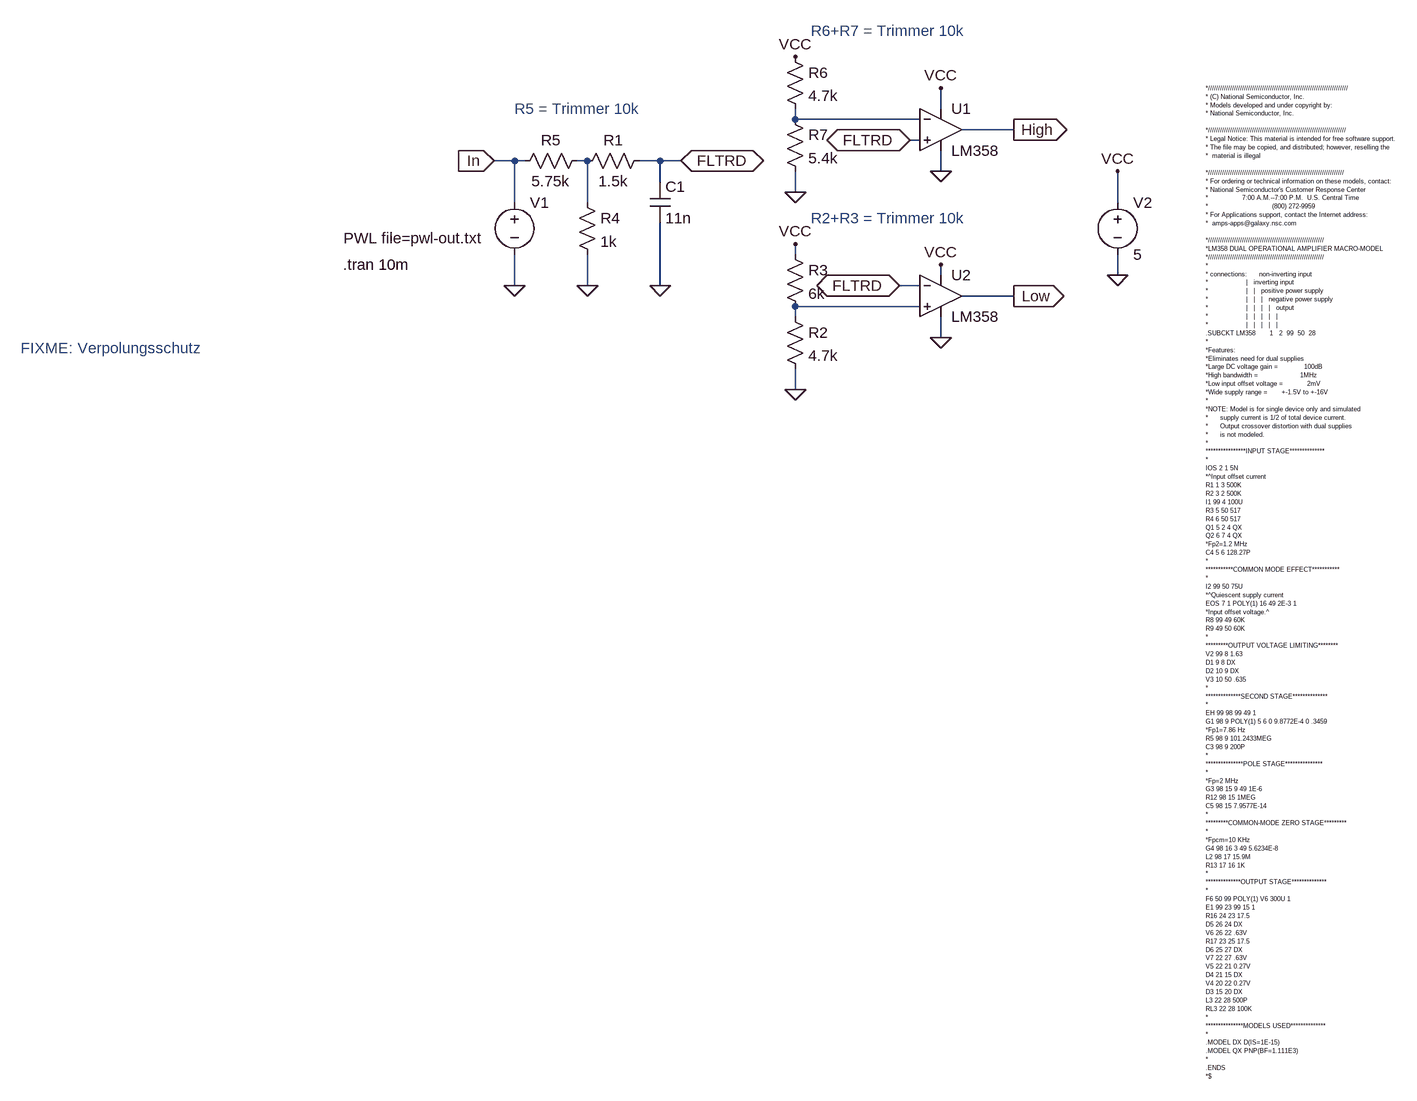
[diagram p0: schematic Konverter_ganzneu2.asc]
Konverter_ganzneu2.asc, the LTspice schematic file:
Version 4
SHEET 1 1720 724
WIRE 720 -656 720 -688
WIRE 496 -640 496 -656
WIRE 688 -640 496 -640
WIRE 832 -624 752 -624
WIRE 688 -608 672 -608
WIRE 64 -576 32 -576
WIRE 80 -576 64 -576
WIRE 176 -576 160 -576
WIRE 288 -576 256 -576
WIRE 320 -576 288 -576
WIRE 720 -560 720 -592
WIRE 288 -544 288 -576
WIRE 496 -528 496 -560
WIRE 64 -512 64 -576
WIRE 176 -512 176 -576
WIRE 992 -512 992 -560
WIRE 496 -432 496 -448
WIRE 720 -400 720 -416
WIRE 992 -400 992 -432
WIRE 64 -384 64 -432
WIRE 176 -384 176 -432
WIRE 288 -384 288 -480
WIRE 688 -384 656 -384
WIRE 832 -368 752 -368
WIRE 688 -352 496 -352
WIRE 496 -336 496 -352
WIRE 720 -304 720 -336
WIRE 496 -224 496 -256
FLAG 64 -384 0
FLAG 32 -576 In
IOPIN 32 -576 In
FLAG 832 -368 Low
IOPIN 832 -368 Out
FLAG 832 -624 High
IOPIN 832 -624 Out
FLAG 176 -384 0
FLAG 288 -384 0
FLAG 720 -560 0
FLAG 720 -304 0
FLAG 496 -528 0
FLAG 496 -224 0
FLAG 992 -400 0
FLAG 992 -560 VCC
FLAG 720 -688 VCC
FLAG 720 -416 VCC
FLAG 496 -736 VCC
FLAG 320 -576 FLTRD
IOPIN 320 -576 BiDir
FLAG 672 -608 FLTRD
IOPIN 672 -608 BiDir
FLAG 496 -448 VCC
FLAG 656 -384 FLTRD
IOPIN 656 -384 BiDir
SYMBOL voltage 64 -528 R0
WINDOW 3 -263 71 Left 2
WINDOW 123 24 44 Left 2
WINDOW 39 24 44 Left 2
SYMATTR Value PWL file=pwl-out.txt
SYMATTR InstName V1
SYMBOL res 272 -592 R90
WINDOW 0 0 56 VBottom 2
WINDOW 3 32 56 VTop 2
SYMATTR InstName R1
SYMATTR Value 1.5k
SYMATTR SpiceLine tol=5
SYMBOL cap 272 -544 R0
SYMATTR InstName C1
SYMATTR Value 11n
SYMATTR SpiceLine V=25 Irms=728m Rser=0.14361 Lser=0
SYMBOL res 160 -528 R0
SYMATTR InstName R4
SYMATTR Value 1k
SYMBOL res 176 -592 R90
WINDOW 0 0 56 VBottom 2
WINDOW 3 32 56 VTop 2
SYMATTR InstName R5
SYMATTR Value 5.75k
SYMBOL voltage 992 -528 R0
WINDOW 123 0 0 Left 0
WINDOW 39 0 0 Left 0
SYMATTR InstName V2
SYMATTR Value 5
SYMBOL res 480 -352 R0
SYMATTR InstName R2
SYMATTR Value 4.7k
SYMBOL res 480 -448 R0
SYMATTR InstName R3
SYMATTR Value 6k
SYMBOL res 480 -752 R0
SYMATTR InstName R6
SYMATTR Value 4.7k
SYMBOL res 480 -656 R0
SYMATTR InstName R7
SYMATTR Value 5.4k
SYMBOL Opamps\\opamp2 720 -688 R0
SYMATTR InstName U1
SYMATTR Value LM358
SYMBOL Opamps\\opamp2 720 -432 R0
SYMATTR InstName U2
SYMATTR Value LM358
TEXT -200 -416 Left 2 !.tran 10m
TEXT 64 -656 Left 2 ;R5 = Trimmer 10k
TEXT 520 -776 Left 2 ;R6+R7 = Trimmer 10k
TEXT 520 -488 Left 2 ;R2+R3 = Trimmer 10k
TEXT -696 -288 Left 2 ;FIXME: Verpolungsschutz
TEXT 1128 -688 Left 0 !*//////////////////////////////////////////////////////////////////////\n* (C) National Semiconductor, Inc.\n* Models developed and under copyright by:\n* National Semiconductor, Inc.  \n \n*/////////////////////////////////////////////////////////////////////\n* Legal Notice: This material is intended for free software support.\n* The file may be copied, and distributed; however, reselling the \n*  material is illegal\n \n*////////////////////////////////////////////////////////////////////\n* For ordering or technical information on these models, contact:\n* National Semiconductor's Customer Response Center\n*                 7:00 A.M.--7:00 P.M.  U.S. Central Time\n*                                (800) 272-9959\n* For Applications support, contact the Internet address:\n*  amps-apps@galaxy.nsc.com\n \n*//////////////////////////////////////////////////////////\n*LM358 DUAL OPERATIONAL AMPLIFIER MACRO-MODEL\n*//////////////////////////////////////////////////////////\n*\n* connections:      non-inverting input\n*                   |   inverting input\n*                   |   |   positive power supply\n*                   |   |   |   negative power supply\n*                   |   |   |   |   output\n*                   |   |   |   |   |\n*                   |   |   |   |   |\n.SUBCKT LM358       1   2  99  50  28\n*\n*Features:\n*Eliminates need for dual supplies\n*Large DC voltage gain =             100dB\n*High bandwidth =                     1MHz\n*Low input offset voltage =            2mV\n*Wide supply range =       +-1.5V to +-16V\n*\n*NOTE: Model is for single device only and simulated\n*      supply current is 1/2 of total device current.\n*      Output crossover distortion with dual supplies\n*      is not modeled.\n*\n****************INPUT STAGE**************\n*\nIOS 2 1 5N\n*^Input offset current\nR1 1 3 500K\nR2 3 2 500K\nI1 99 4 100U\nR3 5 50 517\nR4 6 50 517\nQ1 5 2 4 QX\nQ2 6 7 4 QX\n*Fp2=1.2 MHz\nC4 5 6 128.27P\n*\n***********COMMON MODE EFFECT***********\n*\nI2 99 50 75U\n*^Quiescent supply current\nEOS 7 1 POLY(1) 16 49 2E-3 1\n*Input offset voltage.^\nR8 99 49 60K\nR9 49 50 60K\n*\n*********OUTPUT VOLTAGE LIMITING********\nV2 99 8 1.63\nD1 9 8 DX\nD2 10 9 DX\nV3 10 50 .635\n*\n**************SECOND STAGE**************\n*\nEH 99 98 99 49 1\nG1 98 9 POLY(1) 5 6 0 9.8772E-4 0 .3459\n*Fp1=7.86 Hz\nR5 98 9 101.2433MEG\nC3 98 9 200P\n*\n***************POLE STAGE***************\n*\n*Fp=2 MHz\nG3 98 15 9 49 1E-6\nR12 98 15 1MEG\nC5 98 15 7.9577E-14\n*\n*********COMMON-MODE ZERO STAGE*********\n*\n*Fpcm=10 KHz\nG4 98 16 3 49 5.6234E-8               \nL2 98 17 15.9M\nR13 17 16 1K\n*\n**************OUTPUT STAGE**************\n*\nF6 50 99 POLY(1) V6 300U 1\nE1 99 23 99 15 1\nR16 24 23 17.5\nD5 26 24 DX\nV6 26 22 .63V\nR17 23 25 17.5\nD6 25 27 DX\nV7 22 27 .63V\nV5 22 21 0.27V\nD4 21 15 DX\nV4 20 22 0.27V\nD3 15 20 DX\nL3 22 28 500P\nRL3 22 28 100K\n*\n***************MODELS USED**************\n*\n.MODEL DX D(IS=1E-15)\n.MODEL QX PNP(BF=1.111E3)\n*\n.ENDS\n*$

The netlist it stands for:
* Konverter_ganzneu2.asc
V1 In 0 PWL file=pwl-out.txt
R1 FLTRD N002 1.5k tol=5
C1 FLTRD 0 11n V=25 Irms=728m Rser=0.14361 Lser=0
R4 N002 0 1k
R5 N002 In 5.75k
V2 VCC 0 5
R2 N003 0 4.7k
R3 VCC N003 6k
R6 VCC N001 4.7k
R7 N001 0 5.4k
XU1 FLTRD N001 VCC 0 High LM358  ; pins In+ In- V+ V- OUT
XU2 N003 FLTRD VCC 0 Low LM358  ; pins In+ In- V+ V- OUT
.tran 10m
* R5 = Trimmer 10k
* R6+R7 = Trimmer 10k
* R2+R3 = Trimmer 10k
* FIXME: Verpolungsschutz
*//////////////////////////////////////////////////////////////////////
* (C) National Semiconductor, Inc.
* Models developed and under copyright by:
* National Semiconductor, Inc.
*/////////////////////////////////////////////////////////////////////
* Legal Notice: This material is intended for free software support.
* The file may be copied, and distributed; however, reselling the
*  material is illegal
*////////////////////////////////////////////////////////////////////
* For ordering or technical information on these models, contact:
* National Semiconductor's Customer Response Center
*                 7:00 A.M.--7:00 P.M.  U.S. Central Time
*                                (800) 272-9959
* For Applications support, contact the Internet address:
*  amps-apps@galaxy.nsc.com
*//////////////////////////////////////////////////////////
*LM358 DUAL OPERATIONAL AMPLIFIER MACRO-MODEL
*//////////////////////////////////////////////////////////
*
* connections:      non-inverting input
*                   |   inverting input
*                   |   |   positive power supply
*                   |   |   |   negative power supply
*                   |   |   |   |   output
*                   |   |   |   |   |
*                   |   |   |   |   |
.SUBCKT LM358       1   2  99  50  28
*
*Features:
*Eliminates need for dual supplies
*Large DC voltage gain =             100dB
*High bandwidth =                     1MHz
*Low input offset voltage =            2mV
*Wide supply range =       +-1.5V to +-16V
*
*NOTE: Model is for single device only and simulated
*      supply current is 1/2 of total device current.
*      Output crossover distortion with dual supplies
*      is not modeled.
*
****************INPUT STAGE**************
*
IOS 2 1 5N
*^Input offset current
R1 1 3 500K
R2 3 2 500K
I1 99 4 100U
R3 5 50 517
R4 6 50 517
Q1 5 2 4 QX
Q2 6 7 4 QX
*Fp2=1.2 MHz
C4 5 6 128.27P
*
***********COMMON MODE EFFECT***********
*
I2 99 50 75U
*^Quiescent supply current
EOS 7 1 POLY(1) 16 49 2E-3 1
*Input offset voltage.^
R8 99 49 60K
R9 49 50 60K
*
*********OUTPUT VOLTAGE LIMITING********
V2 99 8 1.63
D1 9 8 DX
D2 10 9 DX
V3 10 50 .635
*
**************SECOND STAGE**************
*
EH 99 98 99 49 1
G1 98 9 POLY(1) 5 6 0 9.8772E-4 0 .3459
*Fp1=7.86 Hz
R5 98 9 101.2433MEG
C3 98 9 200P
*
***************POLE STAGE***************
*
*Fp=2 MHz
G3 98 15 9 49 1E-6
R12 98 15 1MEG
C5 98 15 7.9577E-14
*
*********COMMON-MODE ZERO STAGE*********
*
*Fpcm=10 KHz
G4 98 16 3 49 5.6234E-8
L2 98 17 15.9M
R13 17 16 1K
*
**************OUTPUT STAGE**************
*
F6 50 99 POLY(1) V6 300U 1
E1 99 23 99 15 1
R16 24 23 17.5
D5 26 24 DX
V6 26 22 .63V
R17 23 25 17.5
D6 25 27 DX
V7 22 27 .63V
V5 22 21 0.27V
D4 21 15 DX
V4 20 22 0.27V
D3 15 20 DX
L3 22 28 500P
RL3 22 28 100K
*
***************MODELS USED**************
*
.MODEL DX D(IS=1E-15)
.MODEL QX PNP(BF=1.111E3)
*
.ENDS
*$
.backanno
.end